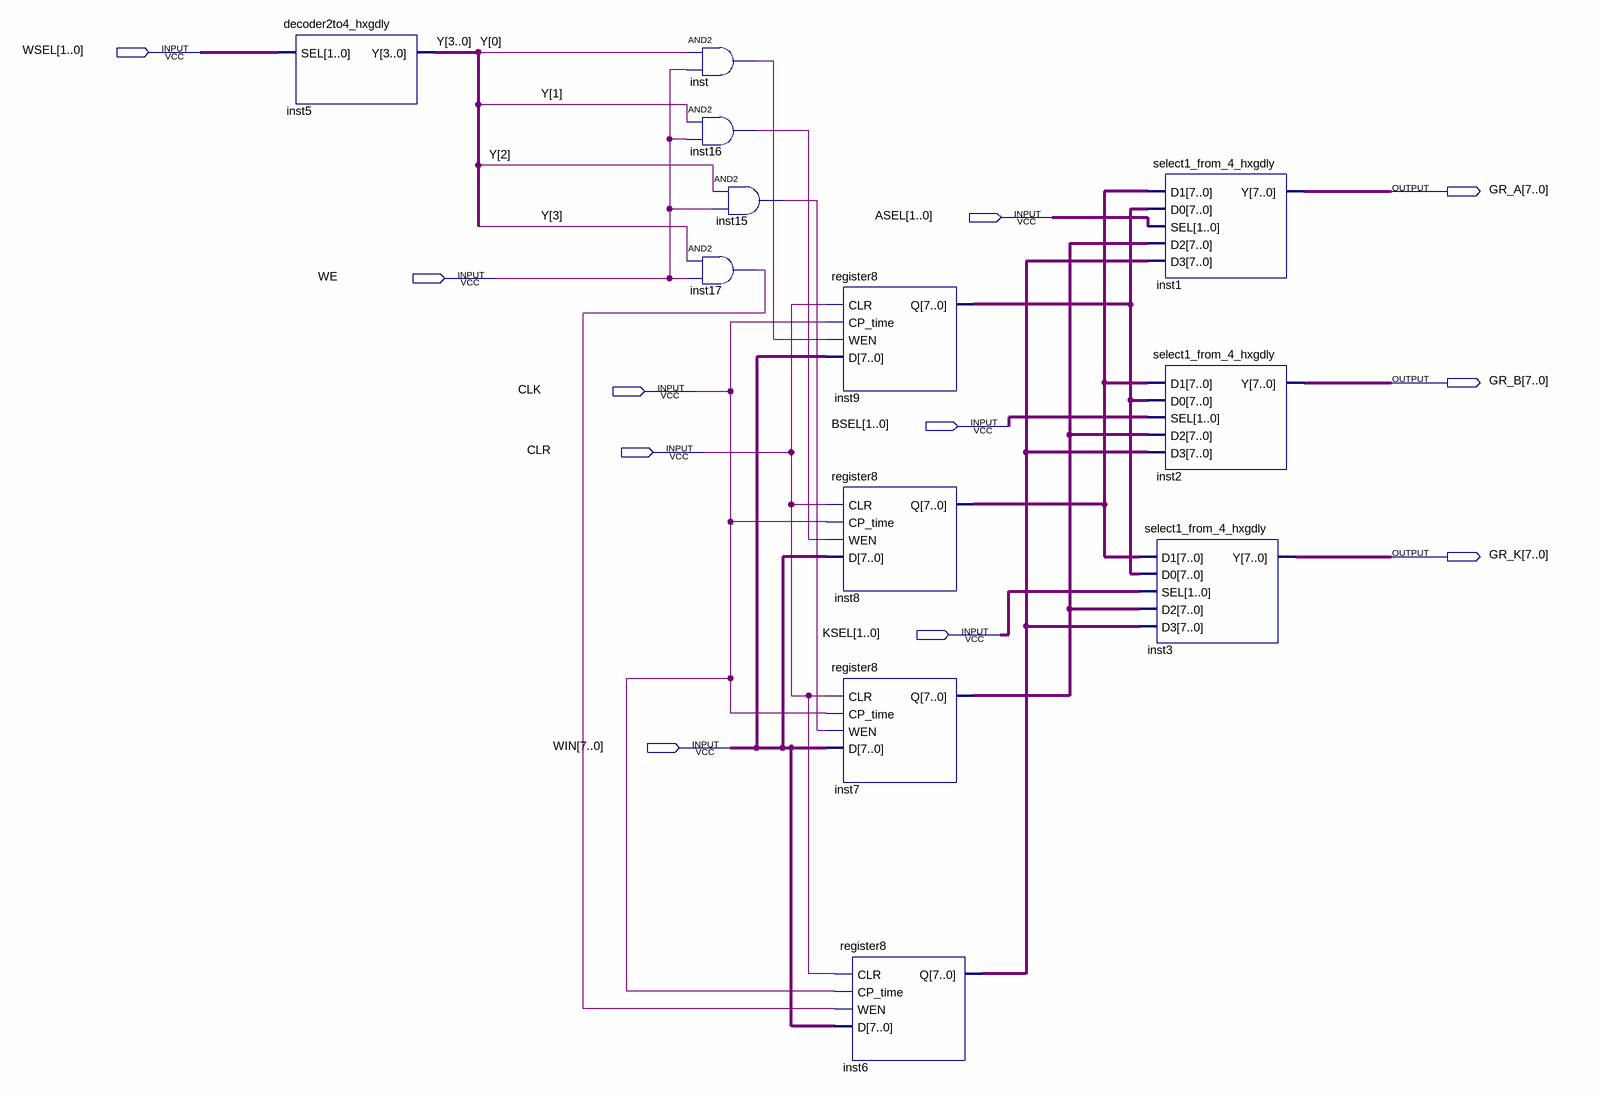
[diagram p0: schematic sheet]
// Quartus schematic GPR_hxgdly.bdf as structural Verilog: 12 symbols, 11 pins
module GPR_hxgdly (
  input  [1:0] WSEL,
  input  [1:0] ASEL,
  input  WE,
  input  CLK,
  input  [1:0] BSEL,
  input  CLR,
  input  [1:0] KSEL,
  input  [7:0] WIN,
  output [7:0] GR_A,
  output [7:0] GR_B,
  output [7:0] GR_K
);

  wire inst15_out, inst16_out, inst17_out, inst_out;
  wire [3:0] Y;
  wire [7:0] inst6_q, inst7_q, inst8_q, inst9_q;

  decoder2to4_hxgdly inst5 (.SEL(WSEL), .Y(Y));
  and inst (inst_out, Y[0], WE);
  and inst16 (inst16_out, Y[1], WE);
  and inst15 (inst15_out, Y[2], WE);
  and inst17 (inst17_out, Y[3], WE);
  register8 inst9 (.CLR(CLR), .CP_time(CLK), .WEN(inst_out), .D(WIN), .Q(inst9_q));
  register8 inst8 (.CLR(CLR), .CP_time(CLK), .WEN(inst16_out), .D(WIN), .Q(inst8_q));
  register8 inst7 (.CLR(CLR), .CP_time(CLK), .WEN(inst15_out), .D(WIN), .Q(inst7_q));
  register8 inst6 (.CLR(CLR), .CP_time(CLK), .WEN(inst17_out), .D(WIN), .Q(inst6_q));
  select1_from_4_hxgdly inst1 (.D1(inst8_q), .D0(inst9_q), .SEL(ASEL), .D2(inst7_q), .D3(inst6_q), .Y(GR_A));
  select1_from_4_hxgdly inst2 (.D1(inst8_q), .D0(inst9_q), .SEL(BSEL), .D2(inst7_q), .D3(inst6_q), .Y(GR_B));
  select1_from_4_hxgdly inst3 (.D1(inst8_q), .D0(inst9_q), .SEL(KSEL), .D2(inst7_q), .D3(inst6_q), .Y(GR_K));
endmodule
